# EAGLE design EMSinterface_V1.0 (EAGLE 7.7.0)
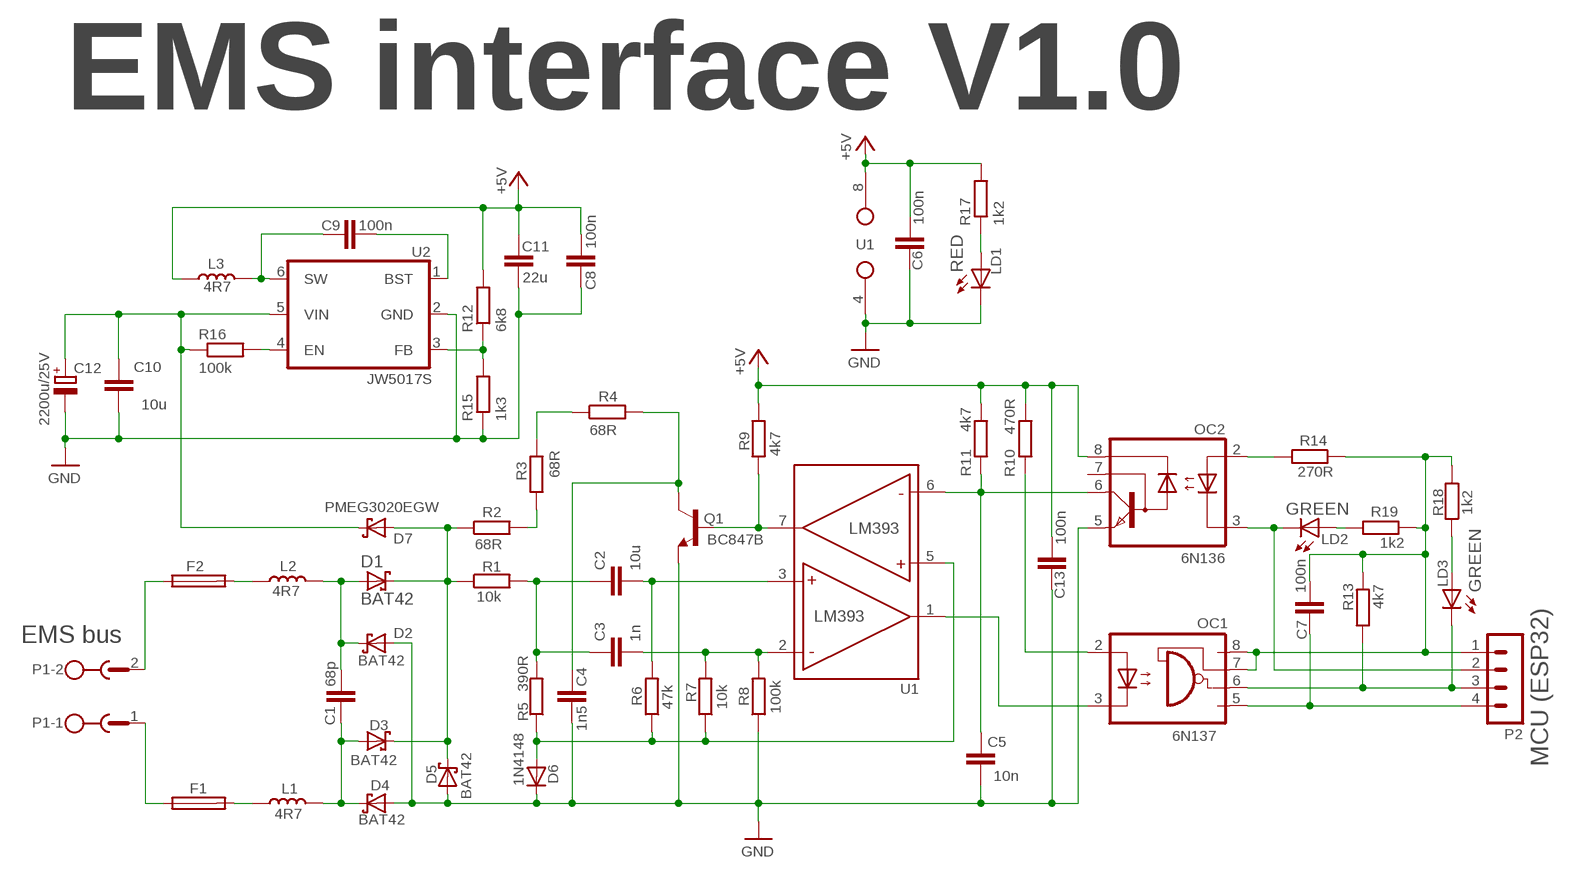
[diagram p0: schematic, sheet 1]

## Parts
C1  68p  C-EUC0805K  [C0805K]
C2  10u  C-EUC0805K  [C0805K]
C3  1n  C-EUC0805K  [C0805K]
C4  1n5  C-EUC0805K  [C0805K]
C5  10n  C-EUC0805K  [C0805K]
C6  100n  C-EUC0805K  [C0805K]
C7  100n  C-EUC0805K  [C0805K]
C8  100n  C-EUC0805K  [C0805K]
C9  100n  C-EUC0805K  [C0805K]
C10  10u  C-EUC0805K  [C0805K]
C11  22u  C-EUC1206  [C1206]
C12  2200u/25V  CPOL-EUE5-10.5  [E5-10,5]
C13  100n  C-EUC0805K  [C0805K]
D1  BAT42  SCHOTTKYSOD123  [SOD123]
D2  BAT42  SCHOTTKYSOD123  [SOD123]
D3  BAT42  SCHOTTKYSOD123  [SOD123]
D4  BAT42  SCHOTTKYSOD123  [SOD123]
D5  BAT42  SCHOTTKYSOD123  [SOD123]
D6  1N4148  [SOD123]
D7  PMEG3020EGW  SCHOTTKYSOD123  [SOD123]
F1  FUSE0805R0805  [R0805]
F2  FUSE0805R0805  [R0805]
L1  4R7  INDUCTORL3225M  [L3225M]
L2  4R7  INDUCTORL3225M  [L3225M]
L3  4R7  INDUCTOR  [INDUCTOR_0520]
LD1  RED  LED0805CHIP-LED0805  [CHIP-LED0805]
LD2  GREEN  LED0805CHIP-LED0805  [CHIP-LED0805]
LD3  GREEN  LED0805CHIP-LED0805  [CHIP-LED0805]
OC1  6N137  6N137SSMD  [SO8-GW300]
OC2  6N136  6N136SSMD  [SO8-GW300]
P1  MSTBA2  [MSTBA2]
P2  CON-LSTB_0408  [CON-LSTB_04]
Q1  BC847B  BC847BBSMD  [SOT23]
R1  10k  R-EUR0805  [R0805]
R2  68R  R-EUR2010  [R2010]
R3  68R  R-EUR2010  [R2010]
R4  68R  R-EUR2010  [R2010]
R5  390R  R-EUR0805  [R0805]
R6  47k  R-EUR0805  [R0805]
R7  10k  R-EUR0805  [R0805]
R8  100k  R-EUR0805  [R0805]
R9  4k7  R-EUR0805  [R0805]
R10  470R  R-EUR0805  [R0805]
R11  4k7  R-EUR0805  [R0805]
R12  6k8  R-EUR0805  [R0805]
R13  4k7  R-EUR0805  [R0805]
R14  270R  R-EUR0805  [R0805]
R15  1k3  R-EUR0805  [R0805]
R16  100k  R-EUR0805  [R0805]
R17  1k2  R-EUR0805  [R0805]
R18  1k2  R-EUR0805  [R0805]
R19  1k2  R-EUR0805  [R0805]
U1  LMV393IDR  LM393  [LM393]
U2  JW5017S  [SOT23-6]

## Nets
+5V: C6.2 C8.1 C11.1 C13.2 L3.1 OC2.8(VCC) R9.2 R10.2 R11.2 R12.2 R17.2 U1.8(VCC)
GND: C4.1 C5.1 C6.1 C8.2 C10.1 C11.2 C12.- C13.1 D2.A D4.A D5.A D6.C LD1.C OC2.5(GND) Q1.2(E) R8.1 R15.1 U1.4(GND) U2.2(GND)
MCUGND: C7.1 OC1.5(GND) P2.4
MCURX: LD3.C OC1.6(VO) P2.3 R13.1
MCUTX: LD2.C OC2.3(C) P2.2
MCUVCC: C7.2 OC1.7(VE) OC1.8(VCC) P2.1 R13.2 R14.1 R18.2 R19.1
N$1: F2.2 L2.1
N$2: F1.2 L1.1
N$3: C1.1 D1.A D2.C L2.2
N$4: C1.2 D3.A D4.C L1.2
N$5: F2.1 P1.2
N$6: D1.C D3.C D5.C D7.A R1.1 R2.1
N$7: D6.A R5.1 R6.1 R7.1 U1.5(IN+)
N$8: C2.1 C3.1 R1.2 R5.2
N$9: C2.2 R6.2 U1.3(IN+)
N$10: C3.2 R7.2 R8.2 U1.2(IN-)
N$11: R3.2 R4.1
N$12: R2.2 R3.1
N$13: C4.2 Q1.3(C) R4.2
N$14: Q1.1(B) R9.1 U1.7(OUT)
N$15: C5.2 OC2.6(VO) R11.1 U1.6(IN-)
N$16: OC1.2(A) R10.1
N$17: F1.1 P1.1
N$18: OC1.3(C) U1.1(OUT)
N$19: OC2.2(A) R14.2
N$20: LD2.A R19.2
N$23: R12.1 R15.2 U2.3(FB)
N$24: LD3.A R18.1
N$25: C9.1 U2.1(BST)
N$26: C9.2 L3.2 U2.6(SW)
N$27: LD1.A R17.1
N$29: R16.2 U2.4(EN)
VIN: C10.2 C12.+ D7.C R16.1 U2.5(VIN)
Unconnected: OC2.7(VB)

## Notes on the sheet
- EMS interface V1.0
- U1
- EMS bus
- U1
- MCU (ESP32)

## Library data of the parts
C1-C11 C13 = EMSinterface_V1.0:C-EU: CAPACITOR, European symbol
C12 = EMSinterface_V1.0:CPOL-EU: POLARIZED CAPACITOR, European symbol
D1-D5 D7 = EMSinterface_V1.0:SCHOTTKY: Schottky Power Rectifier Source: http://www.onsemi.com/pub/Collateral/MBRS130LT3-D.PDF
D6 = EMSinterface_V1.0:1N4148: DIODE high speed (Philips)
F1 F2 = EMSinterface_V1.0:FUSE0805: Fuse
L1-L3 = EMSinterface_V1.0:INDUCTOR
LD1-LD3 = EMSinterface_V1.0:LED0805: LED OSRAM: - CHIPLED LG R971, LG N971, LY N971, LG Q971, LY Q971, LO R971, LY R971 LH N974, LH R974 LS Q976, LO Q976, LY Q976 LO Q996 - Hyper CHIPLED LW Q18S LB Q993, LB Q99A, LB R99A - SideLED LS A670, LO A670, LY A670, LG A670, LP A670 LB A673, LV A673, LT A673, LW A673 LH A674 LY A675 LS A676, LA A676, LO A676, LY A676, LW A676 LS A679, LY A679, LG A679 - Hyper Micro SIDELED® LS Y876, LA Y876, LO Y876, LY Y876 LT Y87S - SmartLED LW L88C, LW L88S LB L89C, LB L89S, LG L890 LS L89K, LO L89K, LY L89K LS L896, LA L896, LO L896, LY L896 - TOPLED LS T670, LO T670, LY T670, LG T670, LP T670 LSG T670, LSP T670, LSY T670, LOP T670, LYG T670 LG T671, LOG T671, LSG T671 LB T673, LV T673, LT T673, LW T673 LH T674 LS T676, LA T676, LO T676, LY T676, LB T676, LH T676, LSB T676, LW T676 LB T67C, LV T67C, LT T67C, LS T67K, LO T67K, LY T67K, LW E67C LS E67B, LA E67B, LO E67B, LY E67B, LB E67C, LV E67C, LT E67C LW T67C LS T679, LY T679, LG T679 LS T770, LO T770, LY T770, LG T770, LP T770 LB T773, LV T773, LT T773, LW T773 LH T774 LS E675, LA E675, LY E675, LS T675 LS T776, LA T776, LO T776, LY T776, LB T776 LHGB T686 LT T68C, LB T68C - Hyper Mini TOPLED® LB M676 - Mini TOPLED Santana® LG M470 LS M47K, LO M47K, LY M47K Source: http://www.osram.convergy.de LUXEON: - LUMILED® LXK2-PW12-R00, LXK2-PW12-S00, LXK2-PW14-U00, LXK2-PW14-V00 LXK2-PM12-R00, LXK2-PM12-S00, LXK2-PM14-U00 LXK2-PE12-Q00, LXK2-PE12-R00, LXK2-PE12-S00, LXK2-PE14-T00, LXK2-PE14-U00 LXK2-PB12-K00, LXK2-PB12-L00, LXK2-PB12-M00, LXK2-PB14-N00, LXK2-PB14-P00, LXK2-PB14-Q00 LXK2-PR12-L00, LXK2-PR12-M00, LXK2-PR14-Q00, LXK2-PR14-R00 LXK2-PD12-Q00, LXK2-PD12-R00, LXK2-PD12-S00 LXK2-PH12-R00, LXK2-PH12-S00 LXK2-PL12-P00, LXK2-PL12-Q00, LXK2-PL12-R00 Source: www.luxeon.com KINGBRIGHT: KA-3528ASYC Source: www.kingbright.com
OC1 = EMSinterface_V1.0:6N137S: MOTOROLA OPTO COUPLER
OC2 = EMSinterface_V1.0:6N136S
P1 = EMSinterface_V1.0:MSTBA2
P2 = EMSinterface_V1.0:CON-LSTB_04
Q1 = EMSinterface_V1.0:BC847B: NPN Transistor
R1-R19 = EMSinterface_V1.0:R-EU: RESISTOR, European symbol
U1 = EMSinterface_V1.0:LM393
U2 = EMSinterface_V1.0:JW5017S

## Board
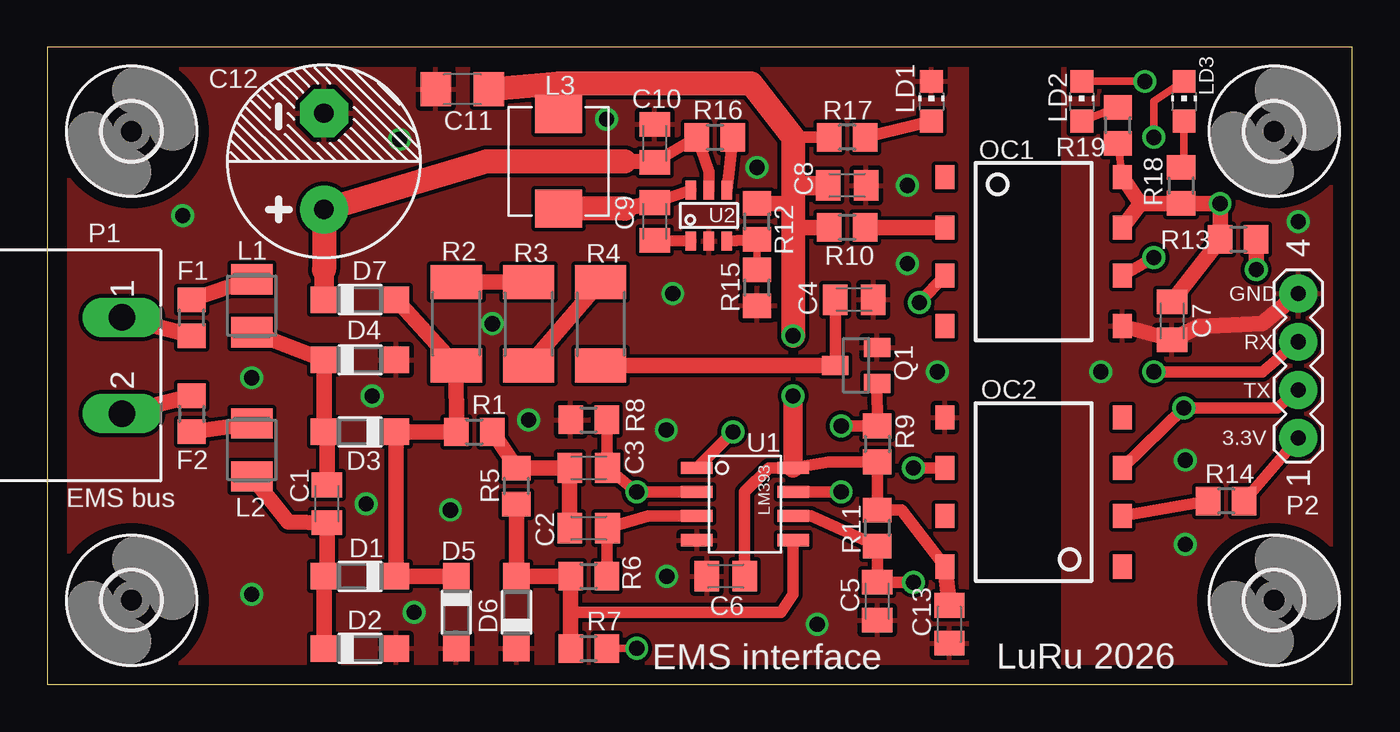
[diagram p1: board, top side]
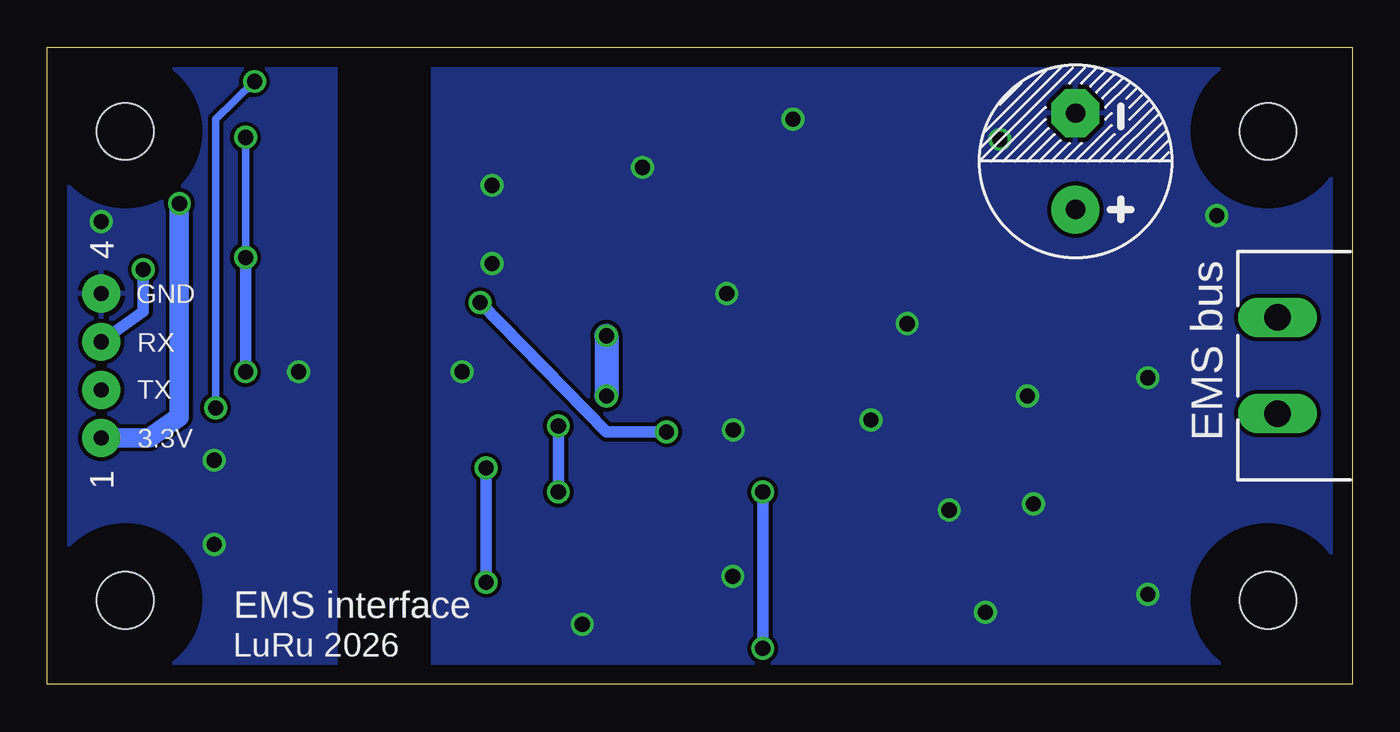
[diagram p2: board, bottom side, seen from below]

Size 68.89 x 33.65 mm. Coordinates in mm from the lower left corner, seen from the top.
Outline: 0,0 68.89,0 68.89,33.65 0,33.65 0,0
Copper layers (1*16): Top 0.035mm / dielectric 1.5mm / Bottom 0.035mm
Design rules "default *": minimum track width 10mil, minimum drill 24mil, track to track 8mil, track to pad 8mil, pad to pad 8mil, via to via 8mil, smd to smd 8mil, copper to edge 40mil, drill to drill 8mil, minimum pad ring 10mil, minimum via ring 8mil, stop-mask expansion 4mil, vias tented up to drill 32mil, thermal gap 10mil

### Footprints (pad centres in the part's own frame; a part is rotated, then mirrored left to right if it is on the bottom)
C0805K = smd 1.3 x 1.6: 1 -1,0; 2 1,0
C1206 = smd 1.6 x 1.8: 1 -1.4,0; 2 1.4,0
E5-10,5 = drill 1.016 pad 2.54: + -2.54,0 | drill 1.016 pad 2.54 octagon: - 2.54,0
SOD123 = smd 1.4 x 1.4: A 1.9,0; C -1.9,0
R0805 = smd 1.3 x 1.5: 1 -0.95,0; 2 0.95,0
L3225M = smd 1.6 x 2.2: 1 -1.4,0; 2 1.4,0
INDUCTOR_0520 = smd 2 x 2.5: 1 -2.5,0; 2 2.5,0
CHIP-LED0805 = smd 1.2 x 1.2: A 0,-1.05; C 0,1.05
SO8-GW300 = smd 1 x 1.27: 1 -4.69,3.937; 2 -4.69,1.27; 3 -4.69,-1.27; 4 -4.69,-3.937; 5 4.69,-3.937; 6 4.69,-1.27; 7 4.69,1.27; 8 4.69,3.937
MSTBA2 = drill 1.397 long: 1 -2.54,2.54; 2 2.54,2.54
CON-LSTB_04 = drill 0.8 pad 2: 1 -3.81,0; 2 -1.27,0; 3 1.27,0; 4 3.81,0
SOT23 = smd 1 x 1.4: 1 -0.95,-1.1; 2 0.95,-1.1; 3 0,1.1
R2010 = smd 1.8 x 2.7: 1 -2.2,0; 2 2.2,0
LM393 = smd 0.635 x 1.651: 1 -1.905,-2.54; 2 -0.635,-2.54; 3 0.635,-2.54; 4 1.905,-2.54; 5 1.905,2.54; 6 0.635,2.54; 7 -0.635,2.54; 8 -1.905,2.54
SOT23-6 = smd 1 x 0.55: 1 -1.35,0.95; 2 -1.35,0; 3 -1.35,-0.95; 4 1.35,-0.95; 5 1.35,0; 6 1.35,0.95
3,0 = hole 3: 0,0

### Placement (x,y rotation side)
C1  14.76,9.54 90 top
C2  28.57,8.26 0 top
C3  28.57,11.43 0 top
C4  42.6,20.32 180 top
C5  43.81,4.39 90 top
C6  35.81,5.71 0 top
C7  59.37,19.21 90 top
C8  42.23,26.35 0 top
C9  32.07,24.45 90 top
C10  32.07,28.57 270 top
C11  21.91,31.43 180 top
C12  14.61,27.62 90 top
C13  47.62,3.17 90 top
D1  16.51,5.71 180 top
D2  16.51,1.91 0 top
D3  16.51,13.34 180 top
D4  16.51,17.14 0 top
D5  21.59,3.81 270 top
D6  24.77,3.81 90 top
D7  16.51,20.32 0 top
F1  7.62,19.37 90 top
F2  7.62,14.29 270 top
L1  10.79,20 270 top
L2  10.79,12.38 270 top
L3  26.99,27.62 270 top
LD1  46.67,30.8 0 top
LD2  54.61,30.8 0 top
LD3  60.01,30.8 0 top
OC1  52.07,22.86 0 top
OC2  52.07,10.16 180 top
P1  1.4,16.84 270 top
P2  66.04,16.83 90 top
Q1  42.7,16.85 90 top
R1  22.54,13.34 0 top
R2  21.59,19.05 90 top
R3  25.4,19.05 270 top
R4  29.21,19.05 270 top
R5  24.77,10.48 90 top
R6  28.57,5.71 0 top
R7  28.57,1.91 0 top
R8  28.57,13.97 0 top
R9  43.81,12.7 270 top
R10  42.23,24.13 180 top
R11  43.81,8.26 90 top
R12  37.47,24.45 90 top
R13  62.87,23.5 180 top
R14  62.23,9.68 180 top
R15  37.47,20.95 90 top
R16  35.24,28.89 0 top
R17  42.23,28.89 180 top
R18  59.85,26.35 270 top
R19  56.52,29.53 90 top
U1  36.83,9.53 270 top
U2  34.92,24.77 90 top
U$6  [3,0]  4.45,4.45 0 top
U$7  [3,0]  4.45,29.21 0 top
U$8  [3,0]  64.77,29.21 0 top
U$9  [3,0]  64.77,4.45 0 top

### Tracks (layer width: path | path; a pad name or v marks a point on that pad's centre or on a via)
+5V  (via drill 0.8)
  Top 0.61: C6.2 36.81,10.16 38.1,11.43 U1.8 41.27,11.75 R9.2 R11.2 45.09,9.21 OC2.8 | R17.2 39.37,28.89
  Top 0.813: R12.2 39.37,25.4 | R10.2 39.37,24.13 | C13.2 OC2.8
  Top 1.016: C8.1 39.37,26.35 | U1.8 v39.37,15.24
  Top 1.27: L3.1 26.99,31.75 | 26.99,31.75 37.15,31.75 39.37,28.89 39.37,26.35 39.37,25.4 39.37,24.13 v39.37,18.41 | C11.1 26.99,31.75
  Bottom 1.27: v39.37,18.41 v39.37,15.24
GND  (via drill 0.8)
  other vias: 45.4,26.35 10.79,16.19 17.14,15.24 7.14,24.77 32.7,5.71 25.4,13.97 37.47,27.3 10.79,4.76 16.83,9.53 19.37,3.81 21.27,9.21 33.02,20.64 32.67,13.44 46.99,16.51 40.64,3.17 23.5,19.05 29.53,29.84 18.6,28.78 45.4,22.23
  pour Top: 0.64,33.02 48.51,33.02 48.51,0.64 0.64,0.64
  pour Bottom: 0.64,33.02 48.51,33.02 48.51,0.64 0.64,0.64
MCUGND  (via drill 0.8)
  Top 0.813: P2.4 64.14,19.05 60.79,18.91 C7.1 OC1.5
  other vias: 66.04,24.45 60.07,7.4 55.63,16.51 60.07,11.84
  pour Top: 53.66,33.02 68.26,33.02 68.26,0.64 53.66,0.64
  pour Bottom: 53.66,33.02 68.26,33.02 68.26,0.64 53.66,0.64
MCURX  (via drill 0.8)
  Top 0.406: LD3.C 58.42,30.8 v58.42,28.89
  Top 0.61: OC1.6 v58.42,22.54 | v58.42,16.51 64.14,16.51 P2.3
  Top 0.813: v63.82,21.91 R13.1
  Bottom 0.406: v58.42,22.54 v58.42,28.89
  Bottom 0.61: P2.3 63.82,19.68 v63.82,21.91 | v58.42,16.51 v58.42,22.54
MCUTX  (via drill 0.8)
  Top 0.406: LD2.C v57.94,31.85
  Top 0.61: OC2.3 v60.01,14.61 64.93,14.61 P2.2
  Bottom 0.406: v60.01,14.61 60.01,29.84 v57.94,31.85
MCUVCC  (via drill 0.8)
  Top 0.406: R19.1 OC1.8
  Top 0.61: R14.1 P2.1
  Top 0.813: OC1.7 57.71,25.4 | 57.71,25.4 OC1.8 | 57.71,25.4 R18.2 v61.91,25.4 R13.2 C7.2
  Bottom 1.016: v61.91,25.4 61.91,14.13 63.5,13.02 P2.1
N$1
  Top 0.813: F2.2 L2.1
N$2
  Top 0.813: F1.2 L1.1
N$3
  Top 0.406: D1.A 14.76,5.71
  Top 0.813: D1.A D2.C | 14.76,5.71 C1.1 12.7,8.57 L2.2
N$4
  Top 0.406: D3.A 14.76,13.34
  Top 0.813: D3.A D4.C L1.2 | 14.76,13.34 C1.2
N$5
  Top 0.813: P1.2 F2.1
N$6
  Top 0.813: D5.C D1.C D3.C R1.1 R2.1 D7.A
N$7
  Top 0.61: 27.62,3.81 38.73,3.81 39.37,4.76 U1.5
  Top 0.813: R5.1 D6.A R6.1 27.62,3.81 R7.1
N$8
  Top 0.813: R1.2 R5.2 C3.1 C2.1
N$9
  Top 0.61: R6.2 C2.2 31.75,8.89 U1.3
N$10  (via drill 0.8)
  Top 0.406: R7.2 v31.11,1.91
  Top 0.61: R8.2 C3.2 v31.11,10.16 U1.2
  Bottom 0.61: v31.11,1.91 v31.11,10.16
N$11
  Top 0.813: R3.2 R4.1
N$12
  Top 0.813: R2.2 R3.1
N$13
  Top 0.61: C4.2 Q1.3
  Top 0.813: R4.2 Q1.3
N$14  (via drill 0.8)
  Top 0.61: Q1.1 R9.1 v41.91,13.65 | U1.7 v41.91,10.16
  Bottom 0.61: v41.91,10.16 v41.91,13.65
N$15  (via drill 0.8)
  Top 0.61: v45.72,11.43 OC2.6 | U1.6 40.32,8.89 R11.1 C5.2 45.09,5.4 v45.72,5.4
  Bottom 0.61: v45.72,5.4 v45.72,11.43
N$16
  Top 0.813: R10.1 OC1.2
N$17
  Top 0.813: P1.1 F1.1
N$18  (via drill 0.8)
  Top 0.61: OC1.3 v46.04,20.16 | v36.2,13.34 U1.1
  Bottom 0.61: v36.2,13.34 39.37,13.34 v46.04,20.16
N$19
  Top 0.61: OC2.2 R14.2
N$20
  Top 0.406: LD2.A R19.2
N$23
  Top 0.406: R12.1 R15.2
  Top 0.61: U2.3 R12.1
N$24
  Top 0.406: LD3.A 60.01,27.62 R18.1
N$25
  Top 0.61: U2.1 C9.1
N$26
  Top 0.61: U2.6 C9.2
  Top 0.813: C9.2 30.48,25.12
  Top 1.27: 30.48,25.12 L3.2
N$27
  Top 0.61: LD1.A R17.1
N$29
  Top 0.61: U2.4 R16.2
VIN
  Top 0.61: C10.2 R16.1 34.93,27.08 U2.5
  Top 0.813: 30.48,27.62 C10.2
  Top 1.016: 14.61,21.91 D7.C
  Top 1.27: 14.61,21.91 C12.+ 23.18,27.62 30.48,27.62

### Text on the board
tPlace: GND | RX | TX | 3.3V
bPlace: GND | RX | TX | 3.3V
tNames: U1 | EMS bus | EMS interface | LuRu 2026
bNames: EMS bus | 4 | 1 | EMS interface | LuRu 2026